# Altium schematic sheet 311prac.SchDoc
size A4; SheetNumber: 1; SheetTotal: 2
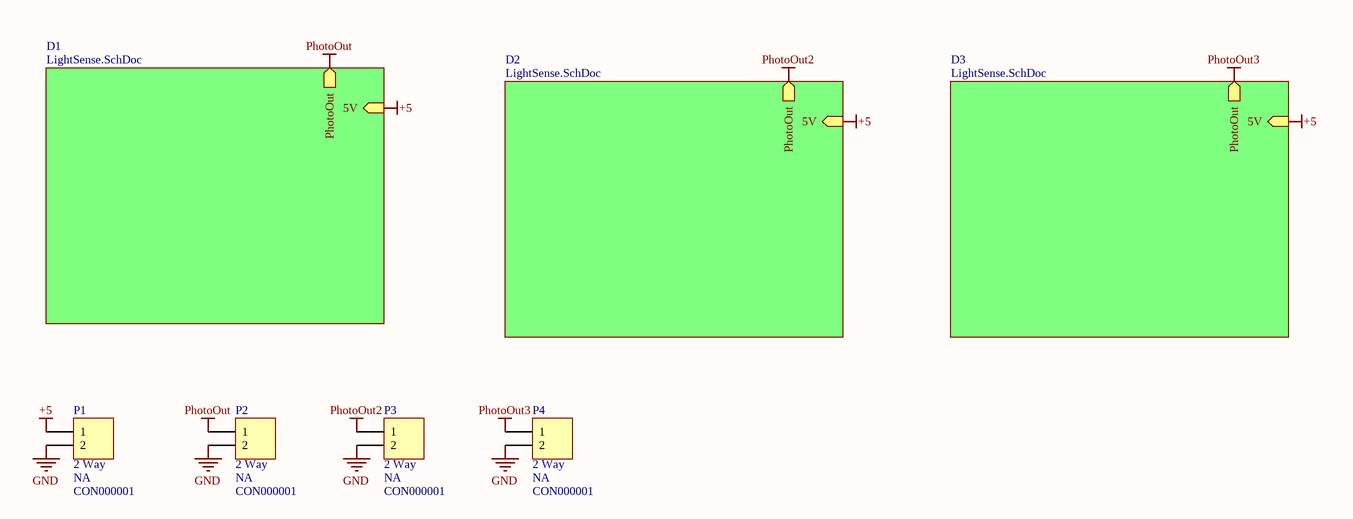
[diagram p0: 311prac.SchDoc]

## Parts
P1  CON000001  value 2 Way  Component Type: NA  [ECE-600102STTH]
P2  CON000001  value 2 Way  Component Type: NA  [ECE-600102STTH]
P3  CON000001  value 2 Way  Component Type: NA  [ECE-600102STTH]
P4  CON000001  value 2 Way  Component Type: NA  [ECE-600102STTH]

## Sub-sheets
D1 = LightSense.SchDoc: PhotoOut (out), 5V (in)
D2 = LightSense.SchDoc: PhotoOut (out), 5V (in)
D3 = LightSense.SchDoc: PhotoOut (out), 5V (in)

## Nets
+5: P1.1 ; sheet D1/5V, sheet D2/5V, sheet D3/5V
GND: P1.2 P2.2 P3.2 P4.2
PhotoOut: P2.1 ; sheet D1/PhotoOut
PhotoOut2: P3.1 ; sheet D2/PhotoOut
PhotoOut3: P4.1 ; sheet D3/PhotoOut

## Library data of the parts
P1-P4 = CMP-040-000000-1: HEADER POLARISED 2WAY TH; Manufacturer-PN: 600102ST; Manufactuer: GTK; Path: ece/ts/Lists/Stock Inventory; Assembly Method: Through hole; Item Type: Item; Supplier2: Active Components; Status: Active; Category: Connector; Supplier2-PN: 600102ST; Supplier1: Elecon; Size/Package: 2.54 Radial; UoA Stock#: CON000001; Datasheet Link: http://share.engineering.auckland.ac.nz/ece/ts/Student%20Documents/polarised_connectors.pdf; Supplier1-PN: YY3N02